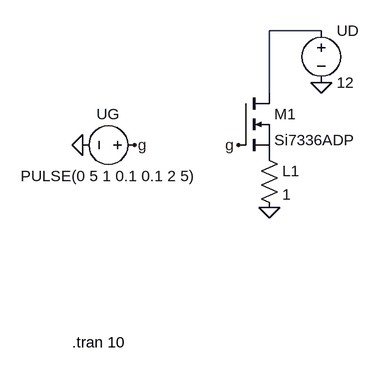
[diagram p0: schematic mosfet_lampe.asc]
mosfet_lampe.asc, the LTspice schematic file:
Version 4.1
SHEET 1 1000 800
WIRE 288 160 208 160
WIRE 208 256 208 160
FLAG 208 432 0
FLAG 288 240 0
FLAG 0 336 g
FLAG -80 336 0
FLAG 160 336 g
SYMBOL nmos 160 256 R0
SYMATTR InstName M1
SYMATTR Value Si7336ADP
SYMBOL res 192 336 R0
SYMATTR InstName L1
SYMATTR Value 1
SYMBOL voltage 288 144 R0
WINDOW 123 0 0 Left 0
WINDOW 39 0 0 Left 0
SYMATTR InstName UD
SYMATTR Value 12
SYMBOL voltage 16 336 R90
WINDOW 0 -32 56 VBottom 2
WINDOW 3 32 56 VTop 2
SYMATTR InstName UG
SYMATTR Value PULSE(0 5 1 0.1 0.1 2 5)
TEXT -96 640 Left 2 !.tran 10

The netlist it stands for:
* mosfet_lampe.asc
M1 N001 g P001 P001 Si7336ADP
R§L1 P001 0 1
V§UD N001 0 12
V§UG g 0 PULSE(0 5 1 0.1 0.1 2 5)
.model NMOS NMOS
.model PMOS PMOS
.lib standard.mos
.tran 10
.backanno
.end